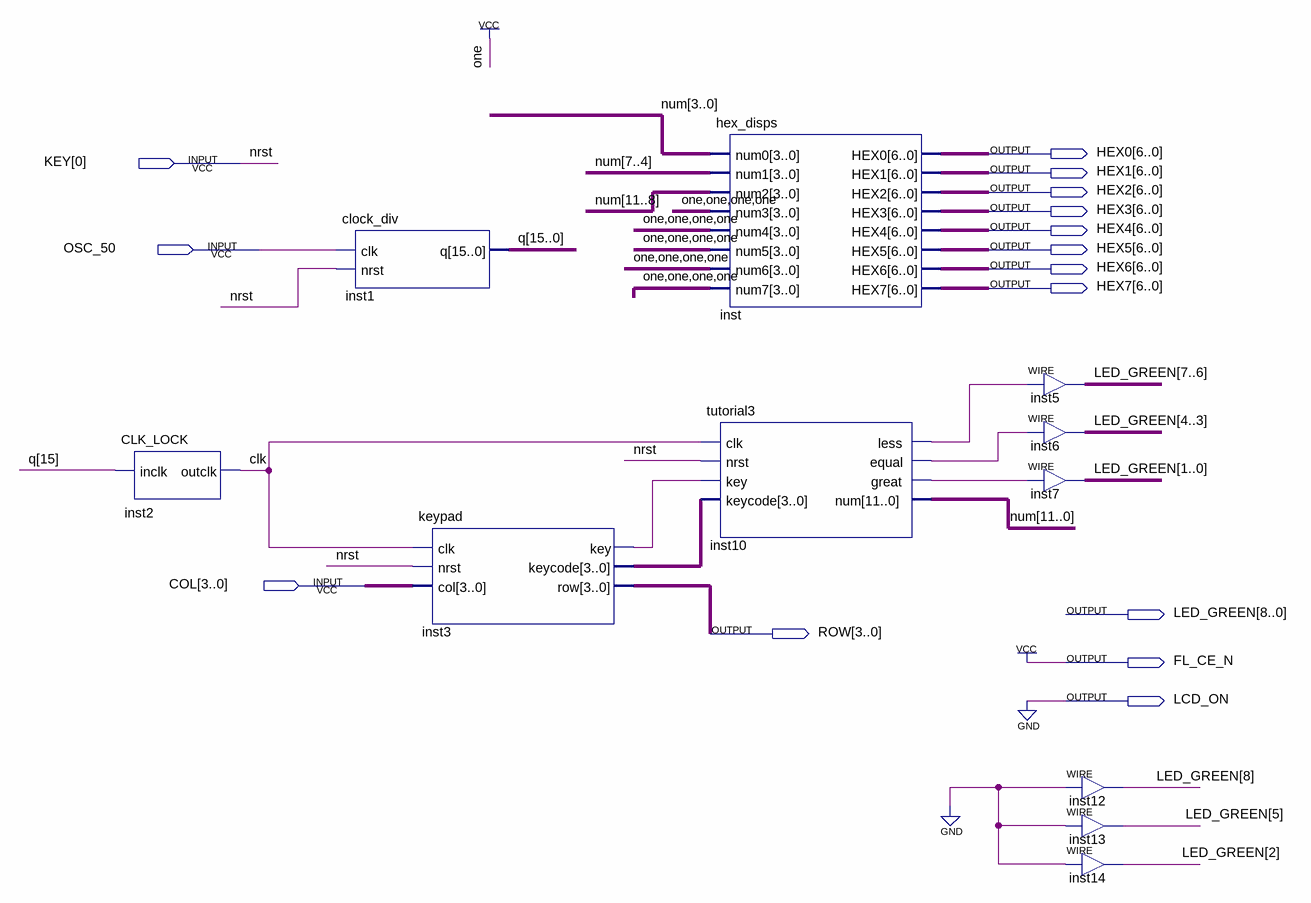
[diagram p0: schematic sheet]
// Quartus schematic game3.bdf as structural Verilog: 11 symbols, 15 pins
module game3 (
  input  [0:0] KEY,
  input  OSC_50,
  input  [3:0] COL,
  output [6:0] HEX0,
  output [6:0] HEX1,
  output [6:0] HEX2,
  output [6:0] HEX3,
  output [6:0] HEX4,
  output [6:0] HEX5,
  output [6:0] HEX6,
  output [6:0] HEX7,
  output [8:0] LED_GREEN,
  output [3:0] ROW,
  output FL_CE_N,
  output LCD_ON
);

  wire clk, inst3_key, inst10_equal, inst10_great, inst10_less;
  wire [3:0] inst3_keycode;
  wire [11:0] num;
  wire [15:0] q;

  CLK_LOCK inst2 (.inclk(q[15]), .outclk(clk));
  clock_div inst1 (.clk(OSC_50), .nrst(KEY[0]), .q(q));
  keypad inst3 (.clk(clk), .nrst(KEY[0]), .col(COL), .key(inst3_key), .keycode(inst3_keycode), .row(ROW));
  hex_disps inst (
    .num0(num[3:0]), .num1(num[7:4]), .num2(num[11:8]), .num3(4'b1111), .num4(4'b1111), .num5(4'b1111),
    .num6(4'b1111), .num7(4'b1111), .HEX0(HEX0), .HEX1(HEX1), .HEX2(HEX2), .HEX3(HEX3), .HEX4(HEX4),
    .HEX5(HEX5), .HEX6(HEX6), .HEX7(HEX7));
  tutorial3 inst10 (
    .clk(clk), .nrst(KEY[0]), .key(inst3_key), .keycode(inst3_keycode), .less(inst10_less),
    .equal(inst10_equal), .great(inst10_great), .num(num));
  assign LED_GREEN[7:6] = {2{inst10_less}};  // WIRE inst5
  assign LED_GREEN[4:3] = {2{inst10_equal}};  // WIRE inst6
  assign LED_GREEN[1:0] = {2{inst10_great}};  // WIRE inst7
  assign LED_GREEN[8] = 1'b0;  // WIRE inst12
  assign LED_GREEN[5] = 1'b0;  // WIRE inst13
  assign LED_GREEN[2] = 1'b0;  // WIRE inst14

  assign FL_CE_N = 1'b1;
  assign LCD_ON = 1'b0;

  // Other names for the same wires on the sheet: nrst = KEY[0]
endmodule
